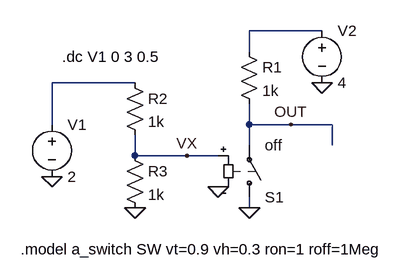
[diagram p0: schematic lt_test_vswitch.asc]
lt_test_vswitch.asc, the LTspice schematic file:
Version 4.1
SHEET 1 880 680
WIRE 368 -48 256 -48
WIRE 256 -16 256 -48
WIRE 80 32 -48 32
WIRE -48 96 -48 32
WIRE 256 96 256 64
WIRE 320 96 256 96
WIRE 384 96 320 96
WIRE 256 128 256 96
WIRE 384 128 384 96
WIRE 80 144 80 112
WIRE 160 144 80 144
WIRE 208 144 160 144
WIRE 256 224 256 208
FLAG 80 224 0
FLAG -48 176 0
FLAG 320 96 OUT
FLAG 160 144 VX
FLAG 256 224 0
FLAG 208 192 0
FLAG 368 32 0
SYMBOL res 240 -32 R0
SYMATTR InstName R1
SYMATTR Value 1k
SYMBOL res 64 16 R0
SYMATTR InstName R2
SYMATTR Value 1k
SYMBOL res 64 128 R0
SYMATTR InstName R3
SYMATTR Value 1k
SYMBOL voltage -48 80 R0
WINDOW 123 0 0 Left 0
WINDOW 39 0 0 Left 0
SYMATTR InstName V1
SYMATTR Value 2
SYMBOL sw 256 224 M180
SYMATTR InstName S1
SYMATTR Value off
SYMATTR SpiceModel a_switch
SYMBOL voltage 368 -64 R0
WINDOW 123 0 0 Left 0
WINDOW 39 0 0 Left 0
SYMATTR InstName V2
SYMATTR Value 4
TEXT -96 288 Left 2 !.model a_switch SW vt=0.9 vh=0.3 ron=1 roff=1Meg
TEXT -32 -8 Left 2 !.dc V1 0 3 0.5

The netlist it stands for:
* lt_test_vswitch.asc
R1 N001 OUT 1k
R2 N002 VX 1k
R3 VX 0 1k
V1 N002 0 2
S1 0 OUT VX 0 a_switch off
V2 N001 0 4
.model a_switch SW vt=0.9 vh=0.3 ron=1 roff=1Meg
.dc V1 0 3 0.5
.backanno
.end